# Altium schematic sheet 06-CPUCTL QCMI SOM.SchDoc: CPU MISC
size 431 x 279 mm; Designer: B. Jordan; DsnPath: G:\My Drive\Quilter Computer - Engineering Assets\NXP i.MX8M-Mini\8MMINILPD4-CPU2-DESIGNFILES\8MMINILPD4-CPU2-DESIGNFILES\SCH-47712_A4.DSN; Author: B. Jordan; DrawnBy: B. Jordan; Revision: 0; SheetNumber: 06; SheetTotal: 10; ENG_APP_DATE: --/--/--; DSN_APP_DATE: --/--/--; CHK_APP_DATE: --/--/--
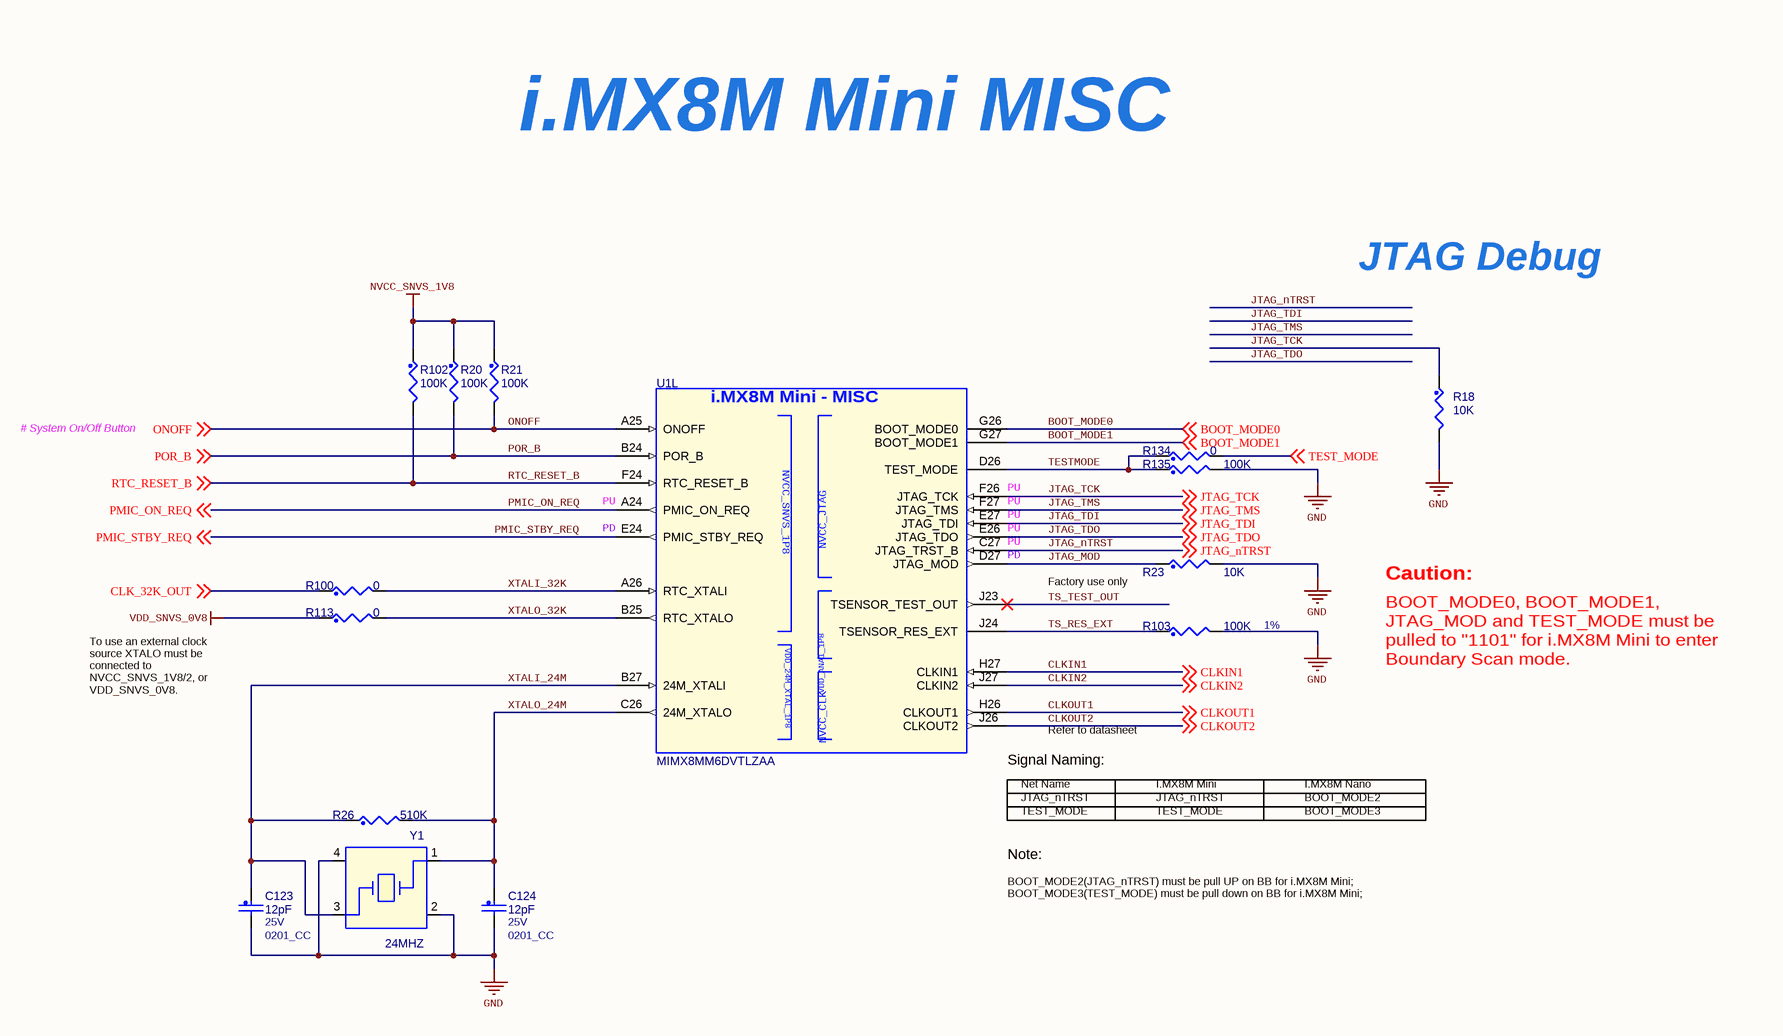
[diagram p0: 06-CPUCTL QCMI SOM.SchDoc]

## Parts
C123  12pF  VOLTAGE: 25V  [0201_CC]
C124  12pF  VOLTAGE: 25V  [0201_CC]
R18  10K  [0201_CC]
R20  100K  [0201_CC]
R21  100K  [0201_CC]
R23  10K  [0201_CC]
R26  510K  [0402_CC]
R100  0  [RC0402_25]
R102  100K  [0201_CC]
R103  100K  Tolerance: 1%  [0201_CC]
R113  0  [RC0402_25]
R134  0  [RC0402_25]
R135  100K  [0201_CC]
U1  MIMX8MM6DVTLZAA  [bga486_0p5_14x14]  (part L of 14)
Y1  24MHZ  [xtlosc4_3p2x2p5mm_sm]

## Nets
GND: C123.2 C124.2 R18.2 R23.2 R103.2 R135.2 Y1.2 Y1.4
NVCC_SNVS_1V8: R20.1 R21.1 R102.1
VDD_SNVS_0V8: R113.1
BOOT_MODE0: U1.G26(BOOT_MODE0) ; off-sheet BOOT_MODE0
BOOT_MODE1: U1.G27(BOOT_MODE1) ; off-sheet BOOT_MODE1
CLK_32K_OUT: R100.1 ; off-sheet CLK_32K_OUT
CLKIN1: U1.H27(CLKIN1) ; off-sheet CLKIN1
CLKIN2: U1.J27(CLKIN2) ; off-sheet CLKIN2
CLKOUT1: U1.H26(CLKOUT1) ; off-sheet CLKOUT1
CLKOUT2: U1.J26(CLKOUT2) ; off-sheet CLKOUT2
JTAG_MOD: R23.1 U1.D27(JTAG_MOD)
JTAG_nTRST: U1.C27(JTAG_TRST_B) ; off-sheet JTAG_nTRST
JTAG_TCK: R18.1 U1.F26(JTAG_TCK) ; off-sheet JTAG_TCK
JTAG_TDI: U1.E27(JTAG_TDI) ; off-sheet JTAG_TDI
JTAG_TDO: U1.E26(JTAG_TDO) ; off-sheet JTAG_TDO
JTAG_TMS: U1.F27(JTAG_TMS) ; off-sheet JTAG_TMS
ONOFF: R21.2 U1.A25(ONOFF) ; off-sheet ONOFF
PMIC_ON_REQ: U1.A24(PMIC_ON_REQ) ; off-sheet PMIC_ON_REQ
PMIC_STBY_REQ: U1.E24(PMIC_STBY_REQ) ; off-sheet PMIC_STBY_REQ
POR_B: R20.2 U1.B24(POR_B) ; off-sheet POR_B
RTC_RESET_B: R102.2 U1.F24(RTC_RESET_B) ; off-sheet RTC_RESET_B
TEST_MODE: R134.2 ; off-sheet TEST_MODE
TESTMODE: R134.1 R135.1 U1.D26(TEST_MODE)
TS_RES_EXT: R103.1 U1.J24(TSENSOR_RES_EXT)
TS_TEST_OUT: U1.J23(TSENSOR_TEST_OUT)
XTALI_24M: C123.1 R26.1 U1.B27(24M_XTALI) Y1.3
XTALI_32K: R100.2 U1.A26(RTC_XTALI)
XTALO_24M: C124.1 R26.2 U1.C26(24M_XTALO) Y1.1
XTALO_32K: R113.2 U1.B25(RTC_XTALO)

## Notes on the sheet
- i.MX8M Mini MISC
- JTAG Debug
- # System On/Off Button
- (near U1) PD
- (near U1) PU
- Factory use only
- Caution:
- BOOT_MODE0, BOOT_MODE1, JTAG_MOD and TEST_MODE must be pulled to "1101" for i.MX8M Mini to enter Boundary Scan mode.
- To use an external clock source XTALO must be connected to NVCC_SNVS_1V8/2, or VDD_SNVS_0V8.
- Refer to datasheet
- (near U1) Signal Naming:
- Net Name
- JTAG_nTRST
- I.MX8M Mini
- I.MX8M Nano
- BOOT_MODE2
- Note:
- TEST_MODE
- BOOT_MODE3
- BOOT_MODE2(JTAG_nTRST) must be pull UP on BB for i.MX8M Mini;
  BOOT_MODE3(TEST_MODE) must be pull down on BB for i.MX8M Mini;
- DWG. NO.
- REV.
- SHT.
- REVISION
- DESCRIPTION
- DATE
- APPROVED
- ENG:
- APPROVALS
- REFERENCE DOCUMENTS
- DSN:
- CHK:
- TITLE
- PROJECT
- BOM:
- ASSY DWG:
- FAB DWG:
- SIZE
- FILE NAME
- B
- SCHEMATIC DOCUMENT NUMBER
- SHEET
- OF
- REV
- PCB DWG:
- (in symbol MIMX8MM_BGA486P, part L) i.MX8M Mini - MISC; VDD_ANA1_1P8

## Library data of the parts
C123 = CAP_NP: CAP CER 12PF 25V 5% C0G AEC-Q200 0201; MFG_NAME01: TDK; MFG_PN01: CGA1A2C0G1E120J030BA; EIA Case: 0201; Temp Range: -55°C ~ 125°C; Value: 12pF; Tolerance: 5%; ROHS: Yes; PCB Footprint: 0201_CC
C124 = CAP_NP: CAP CER 12PF 25V 5% C0G AEC-Q200 0201; MFG_PN01: CGA1A2C0G1E120J030BA; MFG_NAME01: TDK; EIA Case: 0201; Temp Range: -55°C ~ 125°C; Value: 12pF; ROHS: Yes; Tolerance: 5%; PCB Footprint: 0201_CC
R18 = RES: RES MF 10K 1/20W 5% 0201; MFG_NAME01: RALEC ELECTRONIC CORP; MFG_PN01: RTT01103JTH; EIA Case: 0201; Temp Range: -55°C ~ 125°C; Value: 10K; Tolerance: 5%; ROHS: Yes; PCB Footprint: 0201_CC; Rated Power: 1/20W
R20 R21 R102 R103 = RES: RES MF 100K 1/20W 1% 0201; MFG_PN01: RC-0201-104FT; MFG_NAME01: SKYMOS; EIA Case: 0201; Temp Range: -55°C ~ 125°C; Value: 100K; ROHS: Yes; PCB Footprint: 0201_CC; Rated Power: 1/20W
  R20 R21 R102: Tolerance: 1%
R23 = RES: RES MF 10K 1/20W 5% 0201; MFG_PN01: RTT01103JTH; MFG_NAME01: RALEC ELECTRONIC CORP; EIA Case: 0201; Temp Range: -55°C ~ 125°C; Value: 10K; ROHS: Yes; Tolerance: 5%; PCB Footprint: 0201_CC; Rated Power: 1/20W
R26 = RES: RES MF 510K 1/16W 5% 0402; MFG_NAME01: PANASONIC; MFG_PN01: ERJ-2GEJ514X; EIA Case: 0402; Value: 510K; Tolerance: 5%; ROHS: Yes; PCB Footprint: 0402_CC; Rated Power: 1/16W
R100 = RES: RES MF ZERO OHM 1/16W 5% 0402; EIA Case: 0402; MFG_PN01: MCR01MZPJ000; MFG_NAME01: ROHM; Value: 0; ROHS: Yes; Tolerance: 5%; PCB Footprint: RC0402_25; Rated Power: 1/16W
R113 R134 = RES: RES MF ZERO OHM 1/16W 5% 0402; EIA Case: 0402; MFG_NAME01: ROHM; MFG_PN01: MCR01MZPJ000; Value: 0; Tolerance: 5%; ROHS: Yes; PCB Footprint: RC0402_25; Rated Power: 1/16W
R135 = RES: RES MF 100K 1/20W 1% 0201; MFG_NAME01: SKYMOS; MFG_PN01: RC-0201-104FT; EIA Case: 0201; Temp Range: -55°C ~ 125°C; Value: 100K; Tolerance: 1%; ROHS: Yes; PCB Footprint: 0201_CC; Rated Power: 1/20W
U1 = MIMX8MM_BGA486P: IC CPU QUAD CORTEX A53+M4 1.8GHZ BGA486; MFG_NAME01: NXP SEMICONDUCTORS; Value: MIMX8MM6DVTLZAA; MFG_PN01: MIMX8MM6DVTLZAA; ROHS: Yes; PCB Footprint: bga486_0p5_14x14; JEDEC Case: BGA486
Y1 = XTAL_13Y: XTAL 24MHZ 9pF -- SMT 3.2X2.5MM; MFG_PN01: TSX-3225 24.0000MF15X-AC3; MFG_NAME01: EPSON TOYOCOM CORPORATION; EIA Case: 3225 (Metric); Value: 24MHZ; ROHS: Yes; PCB Footprint: xtlosc4_3p2x2p5mm_sm